# Altium schematic sheet OSPI_FLASH、EEPROM.SchDoc
size A4; SheetNumber: 8; SheetTotal: 10
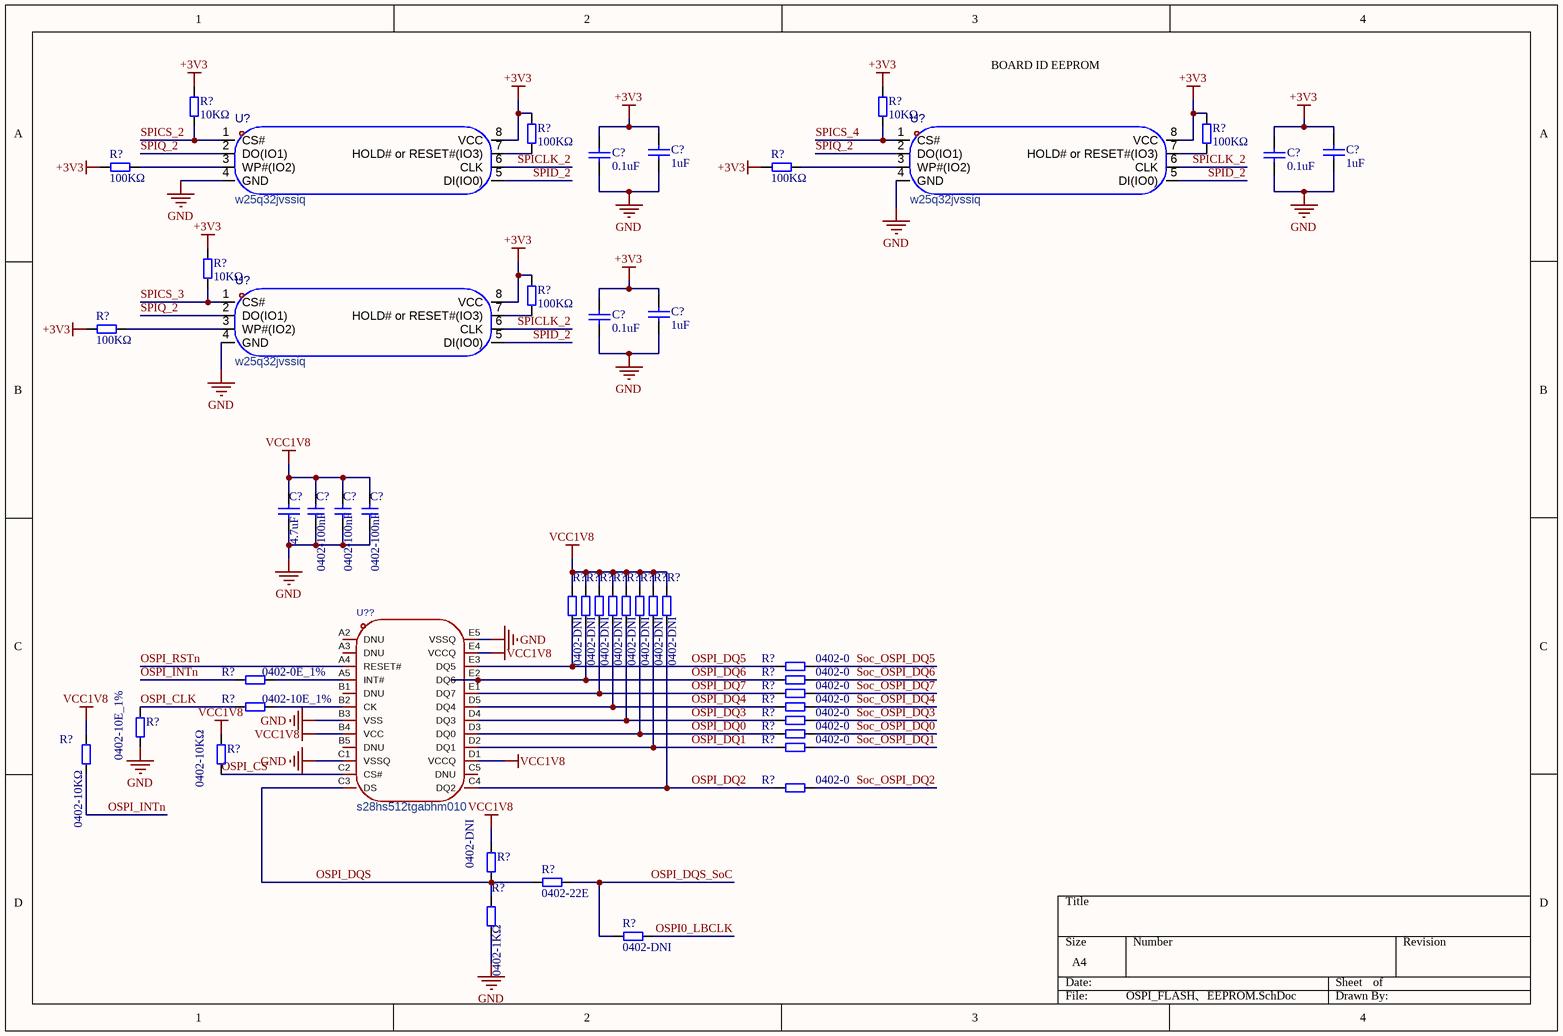
[diagram p0: OSPI_FLASH、EEPROM.SchDoc]

## Parts
(Parts that share a designator on the sheet are numbered #1, #2 ... from top to bottom, then left to right.)
C?#1  0.1uF  [C0603]
C?#2  1uF  [C0603]
C?#3  0.1uF  [C0603]
C?#4  1uF  [C0603]
C?#5  0.1uF  [C0603]
C?#6  1uF  [C0603]
C?#7  0402-100nF  [C0402]
C?#8  0402-100nF  [C0402]
C?#9  0402-100nF  [C0402]
C?#10  4.7uF  [C0603]
R?#1  10KΩ  [R0603]
R?#2  10KΩ  [R0603]
R?#3  100KΩ  [R0603]
R?#4  100KΩ  [R0603]
R?#5  100KΩ  [R0603]
R?#6  100KΩ  [R0603]
R?#7  10KΩ  [R0603]
R?#8  100KΩ  [R0603]
R?#9  100KΩ  [R0603]
R?#10  0402-DNI  [R0402]
R?#11  0402-DNI  [R0402]
R?#12  0402-DNI  [R0402]
R?#13  0402-DNI  [R0402]
R?#14  0402-DNI  [R0402]
R?#15  0402-DNI  [R0402]
R?#16  0402-DNI  [R0402]
R?#17  0402-DNI  [R0402]
R?#18  0402-0  [R0402]
R?#19  0402-0E_1%  [R0402]
R?#20  0402-0  [R0402]
R?#21  0402-0  [R0402]
R?#22  0402-10E_1%  [R0402]
R?#23  0402-10E_1%  [R0402]
R?#24  0402-0  [R0402]
R?#25  0402-0  [R0402]
R?#26  0402-0  [R0402]
R?#27  0402-0  [R0402]
R?#28  0402-10KΩ  [R0402]
R?#29  0402-10KΩ  [R0402]
R?#30  0402-0  [R0402]
R?#31  0402-DNI  [R0402]
R?#32  0402-22E  [R0402]
R?#33  0402-1KΩ  [R0402]
R?#34  0402-DNI  [R0402]
U?#1  w25q32jvssiq  [SOIC-8_L5.3-W5.3-P1.27-LS8.0-BL]
U?#2  w25q32jvssiq  [SOIC-8_L5.3-W5.3-P1.27-LS8.0-BL]
U?#3  w25q32jvssiq  [SOIC-8_L5.3-W5.3-P1.27-LS8.0-BL]
U??  s28hs512tgabhm010  [FBGA-24_L8.0-W6.0-P1.00-BL_SPANSION_VAA024]

## Nets
+3V3: C?#1.2 C?#2.2 C?#3.2 C?#4.2 C?#5.2 C?#6.2 R?#1.1 R?#2.1 R?#3.2 R?#4.2 R?#5.2 R?#6.2 R?#7.1 R?#8.2 R?#9.2 U?#1.8(VCC) U?#2.8(VCC) U?#3.8(VCC)
GND: C?#1.1 C?#2.1 C?#3.1 C?#4.1 C?#5.1 C?#6.1 C?#7.2 C?#8.2 C?#9.2 C?#10.1 R?#22.2 R?#33.1 U?#1.4(GND) U?#2.4(GND) U?#3.4(GND) U??.B3(VSS) U??.C1(VSSQ) U??.E5(VSSQ)
VCC1V8: C?#7.1 C?#8.1 C?#9.1 C?#10.2 R?#10.1 R?#11.1 R?#12.1 R?#13.1 R?#14.1 R?#15.1 R?#16.1 R?#17.1 R?#28.2 R?#29.2 R?#31.1 U??.B4(VCC) U??.D1(VCCQ) U??.E4(VCCQ)
OSPI0_LBCLK: R?#34.2
OSPI_CLK: R?#22.1 R?#23.2
OSPI_CS: R?#29.1 U??.C2(CS#)
OSPI_DQ0: R?#15.2 R?#26.1 U??.D3(DQ0)
OSPI_DQ1: R?#16.2 R?#27.1 U??.D2(DQ1)
OSPI_DQ2: R?#17.2 R?#30.1 U??.C4(DQ2)
OSPI_DQ3: R?#14.2 R?#25.1 U??.D4(DQ3)
OSPI_DQ4: R?#13.2 R?#24.1 U??.D5(DQ4)
OSPI_DQ5: R?#10.2 R?#18.1 U??.E3(DQ5)
OSPI_DQ6: R?#11.2 R?#20.1 U??.E2(DQ6)
OSPI_DQ7: R?#12.2 R?#21.1 U??.E1(DQ7)
OSPI_DQS: R?#31.2 R?#32.1 R?#33.2 U??.C3(DS)
OSPI_DQS_SoC: R?#32.2 R?#34.1
OSPI_INTn: R?#19.2 R?#28.1
OSPI_RSTn: U??.A4(RESET#)
Soc_OSPI_DQ0: R?#26.2
Soc_OSPI_DQ1: R?#27.2
Soc_OSPI_DQ2: R?#30.2
Soc_OSPI_DQ3: R?#25.2
Soc_OSPI_DQ4: R?#24.2
Soc_OSPI_DQ5: R?#18.2
Soc_OSPI_DQ6: R?#20.2
Soc_OSPI_DQ7: R?#21.2
SPICLK_2: U?#1.6(CLK) U?#2.6(CLK) U?#3.6(CLK)
SPICS_2: R?#1.2 U?#1.1(CS#)
SPICS_3: R?#7.2 U?#3.1(CS#)
SPICS_4: R?#2.2 U?#2.1(CS#)
SPID_2: U?#1.5(DI(IO0)) U?#2.5(DI(IO0)) U?#3.5(DI(IO0))
SPIQ_2: U?#1.2(DO(IO1)) U?#2.2(DO(IO1)) U?#3.2(DO(IO1))
NetR?#3_1: R?#3.1 U?#1.7(HOLD#_or_RESET#(IO3))
NetR?#4_1: R?#4.1 U?#2.7(HOLD#_or_RESET#(IO3))
NetR?#5_1: R?#5.1 U?#1.3(WP#(IO2))
NetR?#6_1: R?#6.1 U?#2.3(WP#(IO2))
NetR?#8_1: R?#8.1 U?#3.7(HOLD#_or_RESET#(IO3))
NetR?#9_1: R?#9.1 U?#3.3(WP#(IO2))
NetR?#19_1: R?#19.1 U??.A5(INT#)
NetR?#23_1: R?#23.1 U??.B2(CK)

Not connected (* = marked no-connect by the designer): U?? A2(DNU) A3(DNU) B1(DNU) B5(DNU) C5(DNU)

## Notes on the sheet
- BOARD ID EEPROM

## Library data of the parts
C?#1-C?#6 C?#10 = C0603: Capacitor; Value: 104; Published: 8-Jun-2000; LatestRevisionDate: 17-Jul-2002; LatestRevisionNote: Re-released for DXP Platform.; Publisher: Altium Limited
C?#7-C?#9 = C0402: 物料号: *; 物料描述: *
R?#1-R?#9 = 0603-1KΩ-5%: 片式电阻; 物料描述: 片式电阻器-0805-10KΩ-5%-JT; 物料号: NA
R?#10-R?#34 = R0402: 片式电阻; 物料描述: 片式电阻器-0805-10KΩ-5%-JT; 物料号: NA
U?#1-U?#3 = w25q32jvssiq: 接口类型:SPI;存储容量:32Mbit;时钟频率(fc):133MHz;; Manufacturer: Winbond(华邦); Symbol: W25Q32JVSSIQ_C179173; AddInBom: yes; ModelId: f83d990ad74f400caf5ac920b7771508; ModelName: SOIC-8_L5.3-W5.3-H1.9-LS7.9-P1.27; ModelTransform: 208.661,311.25654,0,0,0,0,-0.0005,0.0005,0; Interface: SPI; Memory Size: 32Mbit; Clock Frequency: 133MHz; Voltage - Supply: 2.7V~3.6V; Standby Supply Current: 1uA; Program / Erase Cycles: 100000次; Page Programming Time (Tpp): 3ms; Data Retention - TDR (Year): 20年; LCSC Part Name: 支持双线、四线SPI接口的3V、32Mbit 串行SPI闪存; SupplierPart: C179173; ManufacturerPart: W25Q32JVSSIQ; Supplier Footprint: SOIC-8-208mil; JLCPCB Part Class: Extended Part; Datasheet: https://item.szlcsc.com/datasheet/W25Q32JVSSIQ/190567.html; Supplier: LCSC; ConvertToPcb: yes; FootprintName: SOIC-8_L5.3-W5.3-P1.27-LS8.0-BL; Write Cycle Time (tWC): -; Block Erase Time(tBE): -; Operating Temperature: -40℃~+85℃; Features: 硬件写保护；绝对写保护；写使能锁存；软件写保护；上电复位
U?? = s28hs512tgabhm010: 接口类型:SPI;存储容量:512Mbit;时钟频率(fc):200MHz;; Manufacturer: Infineon(英飞凌); AddInBom: yes; ModelId: 5d8ea78fdb834f3b8db8343aac7ee720; ModelTransform: 314.96,236.22,0,0,0,0,0,0,0; Interface: SPI; Clock Frequency: 200MHz; Voltage - Supply: 1.7V~2V; Standby Supply Current: 11uA; Program / Erase Cycles: 1280000次; Page Programming Time (Tpp): 753us; Data Retention - TDR (Year): 25年; Symbol: S28HS512TGABHM010; LCSC Part Name: 256-Mb/512-Mb/1-Gb HS-T/HL-T 八线接口闪存; SupplierPart: C6801624; ManufacturerPart: S28HS512TGABHM010; Supplier Footprint: FBGA-24(6x8); JLCPCB Part Class: Extended Part; Datasheet: https://item.szlcsc.com/datasheet/S28HS512TGABHM010/7762037.html; Supplier: LCSC; ConvertToPcb: yes; FootprintName: FBGA-24_L8.0-W6.0-P1.00-BL_SPANSION_VAA024; ModelName: FBGA-24_L8.0-W6.0-P1.00-BL_SPANSION_VAA024; Memory Size: 512Mbit; Write Cycle Time (tWC): -; Block Erase Time(tBE): -; Operating Temperature: -40℃~+85℃; Features: ECC纠错；上电复位